# Altium schematic sheet Power.SchDoc
size B; SheetNumber: 2; SheetTotal: 5
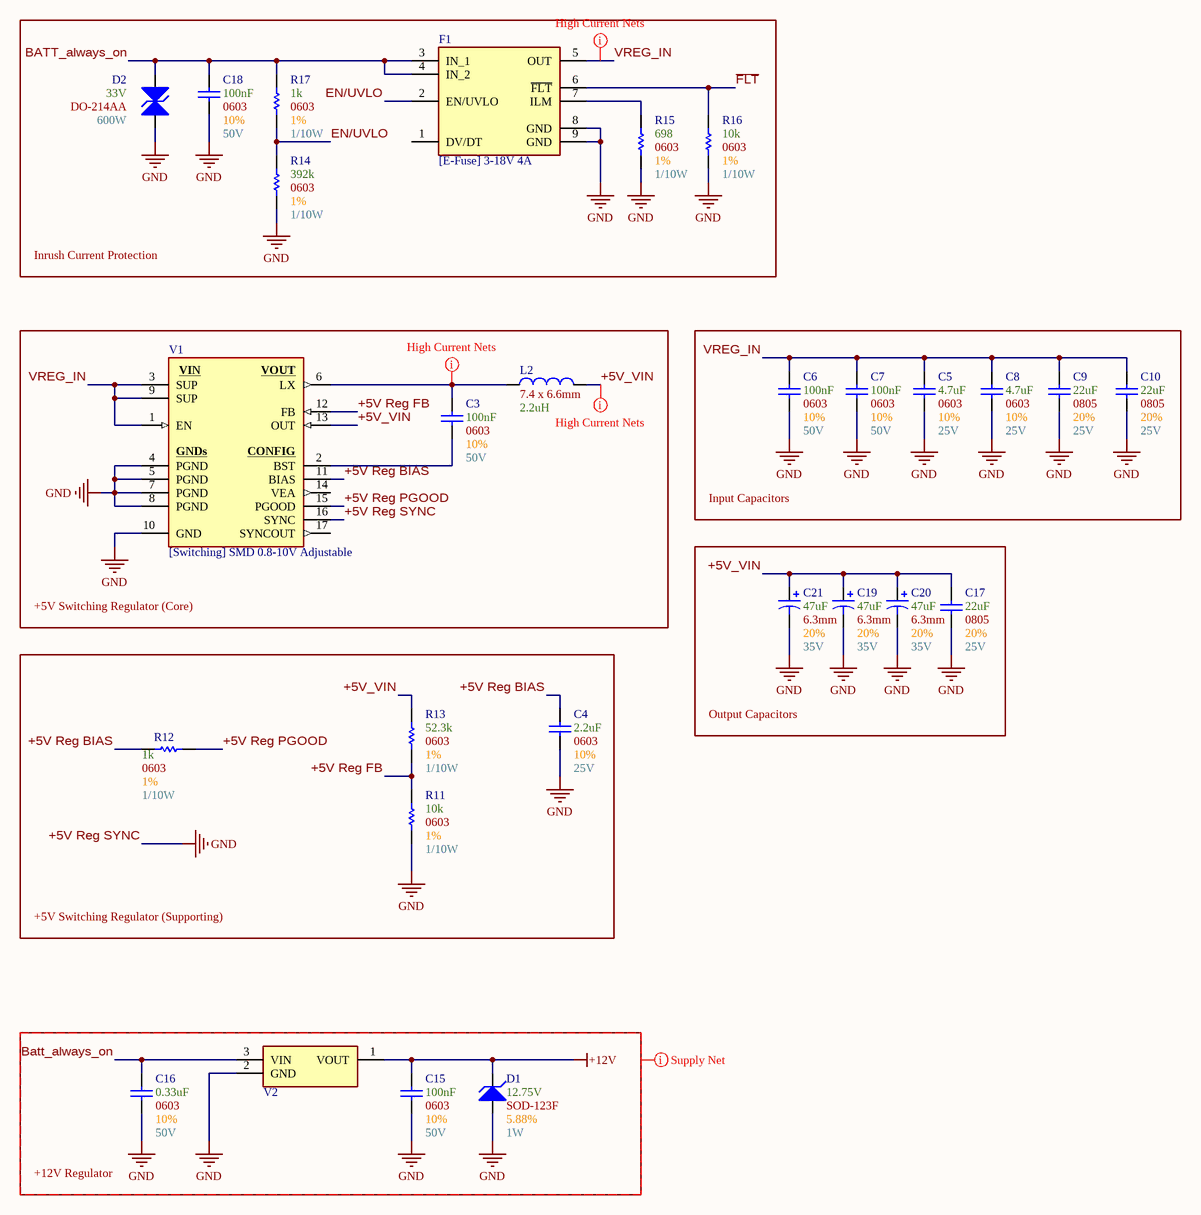
[diagram p0: Power.SchDoc]

## Parts
C3  Max Voltage: 50V  Size Package: 0603  Tolerance: 10%  Capacitance: 100nF  [[Cap] SMD 0603]  (hidden comment: [Cap] 0603 0.1uF 10% 50V)
C4  Max Voltage: 25V  Size Package: 0603  Tolerance: 10%  Capacitance: 2.2uF  [[Cap] SMD 0603]  (hidden comment: [Cap] 0603 2.2uF 10% 25V)
C5  Max Voltage: 25V  Size Package: 0603  Tolerance: 10%  Capacitance: 4.7uF  [[Cap] SMD 0603]  (hidden comment: [Cap] 0603 4.7uF 10% 25V)
C6  Max Voltage: 50V  Size Package: 0603  Tolerance: 10%  Capacitance: 100nF  [[Cap] SMD 0603]  (hidden comment: [Cap] 0603 0.1uF 10% 50V)
C7  Max Voltage: 50V  Size Package: 0603  Tolerance: 10%  Capacitance: 100nF  [[Cap] SMD 0603]  (hidden comment: [Cap] 0603 0.1uF 10% 50V)
C8  Max Voltage: 25V  Size Package: 0603  Tolerance: 10%  Capacitance: 4.7uF  [[Cap] SMD 0603]  (hidden comment: [Cap] 0603 4.7uF 10% 25V)
C9  Max Voltage: 25V  Size Package: 0805  Tolerance: 20%  Capacitance: 22uF  [[Cap] SMD 0805]  (hidden comment: [Cap] 0805 22uF 20% 25V)
C10  Max Voltage: 25V  Size Package: 0805  Tolerance: 20%  Capacitance: 22uF  [[Cap] SMD 0805]  (hidden comment: [Cap] 0805 22uF 20% 25V)
C15  Max Voltage: 50V  Size Package: 0603  Tolerance: 10%  Capacitance: 100nF  [[Cap] SMD 0603]  (hidden comment: [Cap] 0603 0.1uF 10% 50V)
C16  Max Voltage: 50V  Size Package: 0603  Tolerance: 10%  Capacitance: 0.33uF  [[Cap] SMD 0603]  (hidden comment: [Cap] 0603 0.33uF 10% 50V)
C17  Max Voltage: 25V  Size Package: 0805  Tolerance: 20%  Capacitance: 22uF  [[Cap] SMD 0805]  (hidden comment: [Cap] 0805 22uF 20% 25V)
C18  Max Voltage: 50V  Size Package: 0603  Tolerance: 10%  Capacitance: 100nF  [[Cap] SMD 0603]  (hidden comment: [Cap] 0603 0.1uF 10% 50V)
C19  Max Voltage: 35V  Size Package: 6.3mm  Tolerance: 20%  Capacitance: 47uF  [[Cap] SMD Polarized, 6.3mm]  (hidden comment: [Cap] 6.3mm 47uF 20% 35V)
C20  Max Voltage: 35V  Size Package: 6.3mm  Tolerance: 20%  Capacitance: 47uF  [[Cap] SMD Polarized, 6.3mm]  (hidden comment: [Cap] 6.3mm 47uF 20% 35V)
C21  Max Voltage: 35V  Size Package: 6.3mm  Tolerance: 20%  Capacitance: 47uF  [[Cap] SMD Polarized, 6.3mm]  (hidden comment: [Cap] 6.3mm 47uF 20% 35V)
D1  Tolerance: 5.88%  Wattage: 1W  Optimal Zener Voltage: 12.75V  [[Diode] SOD-123F]  (hidden comment: SOD-123F)
D2  Wattage: 600W  Optimal Zener Voltage: 33V  [[Diode] SMD DO-214AA]  (hidden comment: DO-214AA)
F1  [E-Fuse] 3-18V 4A  [[E-Fuse] 3-18V 4A]
L2  Package: 7.4 x 6.6mm  Inductance: 2.2uH  [[Inductor] SMD 7.4 X 6.6 X 3 MM]  (hidden comment: [2.2uH] SMD Nonstandard 10A)
R11  Wattage: 1/10W  Tolerance: 1%  Resistance: 10k  Size Package: 0603  [[Res] SMD 0603]  (hidden comment: [10k] SMD 0603 1% 1/8W)
R12  Wattage: 1/10W  Tolerance: 1%  Resistance: 1k  Size Package: 0603  [[Res] SMD 0603]  (hidden comment: [1k] SMD 0603 1% 1/10W)
R13  Wattage: 1/10W  Tolerance: 1%  Resistance: 52.3k  Size Package: 0603  [[Res] SMD 0603]  (hidden comment: [52.3k] SMD 0603 1% 1/10W)
R14  Wattage: 1/10W  Tolerance: 1%  Resistance: 392k  Size Package: 0603  [[Res] SMD 0603]  (hidden comment: [392k] SMD 0603 1% 1/10W)
R15  Wattage: 1/10W  Tolerance: 1%  Resistance: 698  Size Package: 0603  [[Res] SMD 0603]  (hidden comment: [698] SMD 0603 1% 1/10W_1)
R16  Wattage: 1/10W  Tolerance: 1%  Resistance: 10k  Size Package: 0603  [[Res] SMD 0603]  (hidden comment: [10k] SMD 0603 1% 1/8W)
R17  Wattage: 1/10W  Tolerance: 1%  Resistance: 1k  Size Package: 0603  [[Res] SMD 0603]  (hidden comment: [1k] SMD 0603 1% 1/10W)
V1  [Switching] SMD 0.8-10V Adjustable  [[Switching] 0.8-10V Adjustable Buck]
V2  [Linear] SMD 12V 0.1A  [[Linear] SMD 12V 0.1A]  (value not drawn)

## Blocks framed on the sheet
Inrush Current Protection: C18 D2 F1 R14-R17
+5V Switching Regulator (Core): C3 L2 V1
Input Capacitors: C5-C10
Output Capacitors: C17 C19-C21
+5V Switching Regulator (Supporting): C4 R11-R13
+12V Regulator: C15 C16 D1 V2

## Nets
+5V Reg SYNC: C4.1 C5.1 C6.1 C7.1 C8.1 C9.1 C10.1 C15.1 C16.1 C17.1 C18.1 C19.2 C20.2 C21.2 D1.2(A) D2.1(A) F1.8(GND) F1.9(GND) R11.1 R14.1 R15.1 R16.1 V1.4(PGND) V1.5(PGND) V1.7(PGND) V1.8(PGND) V1.10(GND) V1.16(SYNC) V2.2(GND)  [also labelled GND]
+12V: C15.2 D1.1(K) V2.1(VOUT)
+5V Reg BIAS: C4.2 R12.1 V1.11(BIAS)
+5V Reg FB: R11.2 R13.1 V1.12(FB)
+5V Reg PGOOD: R12.2 V1.15(PGOOD)
+5V_VIN: C17.2 C19.1 C20.1 C21.1 L2.2 R13.2 V1.13(OUT)
~{FLT}: F1.6(~{FLT}) R16.2
BATT_always_on: C16.2 C18.2 D2.2(K) F1.3(IN_1) F1.4(IN_2) R17.2 V2.3(VIN)
EN/UVLO: F1.2(EN/UVLO) R14.2 R17.1
VREG_IN: C5.2 C6.2 C7.2 C8.2 C9.2 C10.2 F1.5(OUT) V1.1(EN) V1.3(SUP) V1.9(SUP)
NetC3_1: C3.1 V1.2(BST)
NetC3_2: C3.2 L2.1 V1.6(LX)
NetF1_7: F1.7(ILM) R15.2

Not connected (* = marked no-connect by the designer): F1 1(DV/DT); V1 14(VEA) 17(SYNCOUT)

## Layout directives
net class High_Current_Nets: +5V_VIN, NetC3_2, VREG_IN
net class Supply_Nets: +12V, Batt_always_on, GND

## Notes on the sheet
- (in symbol [Switching] SMD 0.8-10V Adjustable) VIN; VOUT; GNDs; CONFIG

## Library data of the parts
C3 C6 C7 C15 C18 = [Cap] 0603 0.1uF 10% 50V: CL10B104KB8NNNC; Supplier 1: DigiKey; Supplier Part Number 1: 1276-1000-6-ND
C4 = [Cap] 0603 2.2uF 10% 25V: GRM188R61E225KA12D; Supplier 1: DigiKey; Supplier Part Number 1: 490-10731-1-ND
C5 C8 = [Cap] 0603 4.7uF 10% 25V: GRM188R61E475KE11D; Supplier 1: DigiKey; Supplier Part Number 1: 490-7203-6-ND
C9 C10 C17 = [Cap] 0805 22uF 20% 25V: CL21A226MAYNNWE; Supplier 1: DigiKey; Supplier Part Number 1: 1276-CL21A226MAYNNWECT-ND
C16 = [Cap] 0603 0.33uF 10% 50V: CGA3E3X7R1H334K080AB; Supplier 1: DigiKey; Supplier Part Number 1: 445-174426-1-ND
C19-C21 = [Cap] 6.3mm 47uF 20% 35V: UWT1V470MCL1GS; Supplier 1: DigiKey; Supplier Part Number 1: 493-2202-1-ND
D1 = [Zener] SMD 12.75V 1W 5.88%: KDZVTR12B; Supplier 1: DigiKey; Supplier Part Number 1: KDZVTR12BCT-ND; Footprint: SOD-123F
D2 = [TVS] SMBJ33CA: SMBJ33CA; Supplier 1: DigiKey; Supplier Part Number 1: SMBJ33CA-FDICT-ND; Footprint: DO-214AA
F1 = [E-Fuse] 3-18V 4A: TPS259571DSGR; Supplier 1: DigiKey; Supplier Part Number 1: 296-50500-1-ND
L2 = [2.2uH] SMD Nonstandard 10A: ECS-MPIL0630-2R2MC; Supplier 1: DigiKey; Supplier Part Number 1: XC2402CT-ND
R11 R16 = [10k] SMD 0603 1% 1/8W: RMCF0603FT10K0; Supplier 1: DigiKey; Supplier Part Number 1: RMCF0603FT10K0DKR-ND
R12 R17 = [1k] SMD 0603 1% 1/10W: RMCF0603FT1K00; Supplier 1: DigiKey; Supplier Part Number 1: RMCF0603FT1K00DKR-ND
R13 = [52.3k] SMD 0603 1% 1/10W: RC0603FR-0752K3L; Supplier 1: DigiKey; Supplier Part Number 1: 311-52.3KHRCT-ND
R14 = [392k] SMD 0603 1% 1/10W: CR0603-FX-3923ELF; Supplier 1: DigiKey; Supplier Part Number 1: 118-CR0603-FX-3923ELFCT-ND
R15 = [698] SMD 0603 1% 1/10W_1: RMCF0603FT698R; Supplier 1: DigiKey; Supplier Part Number 1: RMCF0603FT698RCT-ND
V1 = [Switching] SMD 0.8-10V Adjustable: MAX20408AFOF/VY+; Supplier 1: DigiKey; Supplier Part Number 1: 505-MAX20408AFOF/VY+-ND
V2 = [Linear] SMD 12V 0.1A: L78L12ACUTR; Supplier 1: DigiKey; Supplier Part Number 1: 497-1195-1-ND